# Altium schematic sheet FP_Connectors.SchDoc: =DocumentName
size A4; SPICEModelCache: <root> / <DocumentId>EZLIUZWI</DocumentId> / <CacheFrame Number="0"> / <Model Name="0603_155060gs75300" Kind="CKT"> / <Text>******** / .subckt 0603_155060GS75300 1 2 / D1 1 2 SMSW / .MODEL SMSW D / + IS=695.94E-6 / + N=5 / + RS=2.4677 / + IKF=16.109E-12 / + CJO=1.0000E-12 / + M=.3333 / + VJ=.75 / + BV=5 / + IBV=10.00E-6 / + TT=5.0000E-9 / .ends</Text> / </Model> / </CacheFrame> / </root>; Last modified by: Krzysztof Belewicz; DocumentNumber: 1; Revision: 0; SheetNumber: 1; SheetTotal: 1
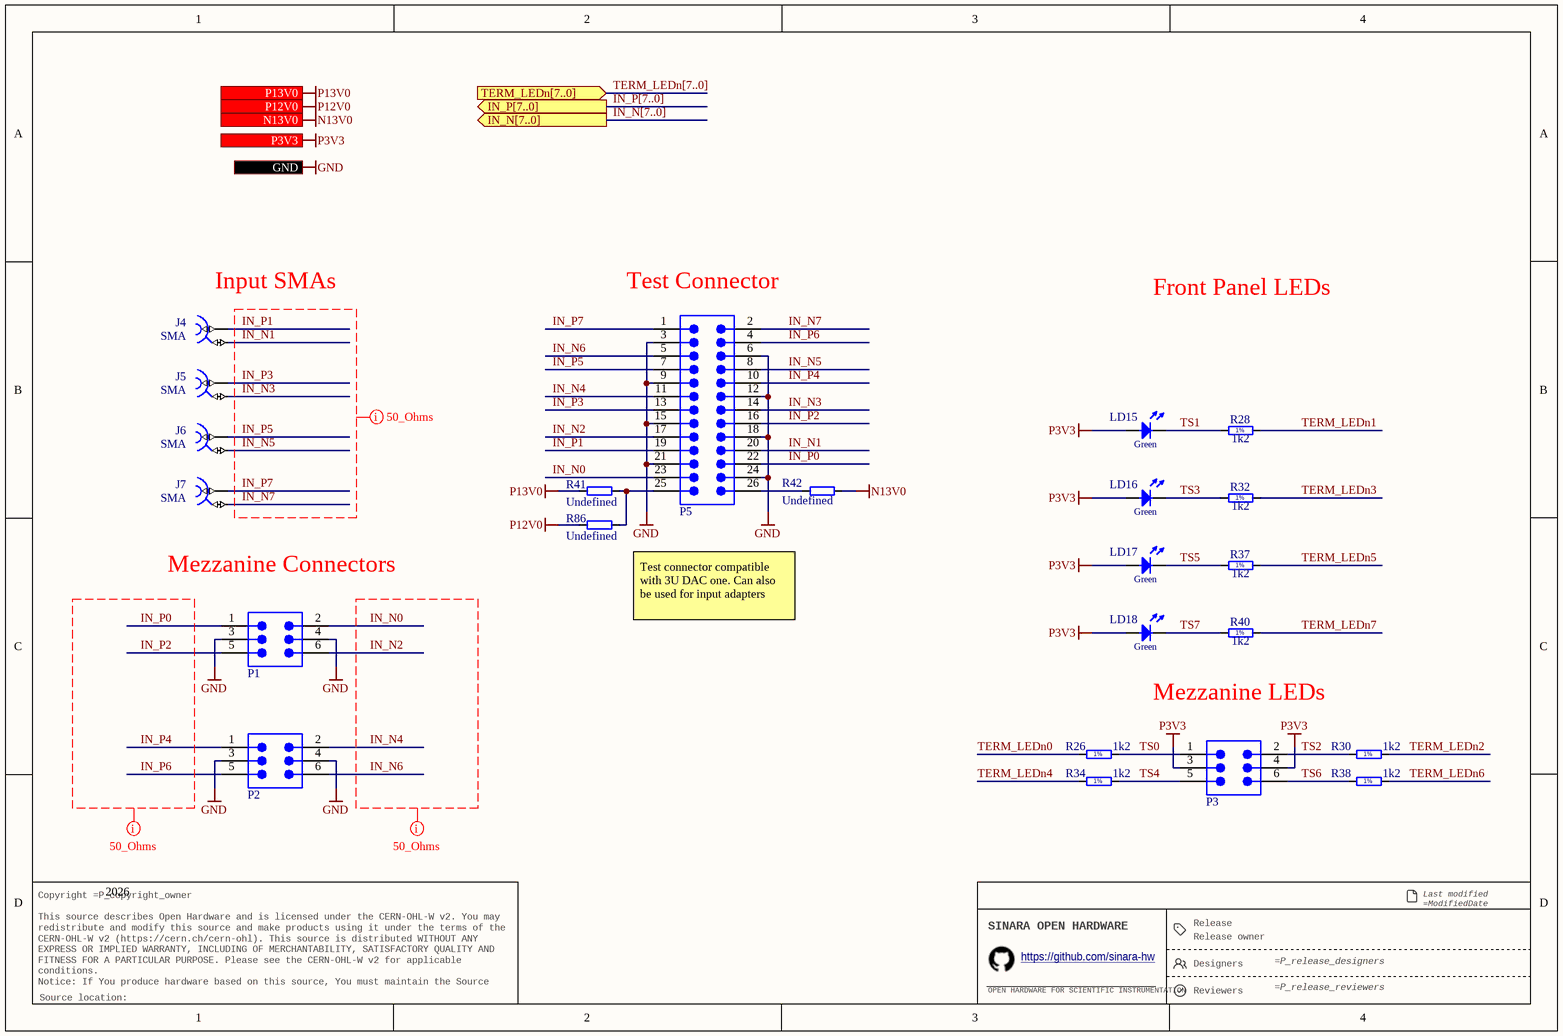
[diagram p0: FP_Connectors.SchDoc]

## Parts
J4  SMA  [DELOCK_65848]
J5  SMA  [DELOCK_65848]
J6  SMA  [DELOCK_65848]
J7  SMA  [DELOCK_65848]
LD15  Green  [LED_AVAGO_HSME-C120]
LD16  Green  [LED_AVAGO_HSME-C120]
LD17  Green  [LED_AVAGO_HSME-C120]
LD18  Green  [LED_AVAGO_HSME-C120]
P1  61300621121  [61300621121]  (value not drawn)
P2  61300621121  [61300621121]  (value not drawn)
P3  61300621121  [61300621121]  (value not drawn)
P5  61302621121  [61302621121]  (value not drawn)
R26  1k2  [RESC1608X55N]
R28  1k2  [RESC1608X55N]
R30  1k2  [RESC1608X55N]
R32  1k2  [RESC1608X55N]
R34  1k2  [RESC1608X55N]
R37  1k2  [RESC1608X55N]
R38  1k2  [RESC1608X55N]
R40  1k2  [RESC1608X55N]
R41  Undefined  [RESC1608X55N]
R42  Undefined  [RESC1608X55N]
R86  Undefined  [RESC1608X55N]

## Ports
GND, IN_N[7..0] (out), IN_P[7..0] (out), N13V0 (in), P3V3 (in), P12V0 (in), P13V0 (in), TERM_LEDn[7..0] (in)

## Nets
GND: P1.3 P1.4 P2.3 P2.4 P5.3 P5.6 P5.9 P5.12 P5.15 P5.18 P5.21 P5.24 ; port GND
N13V0: R42.2 ; port N13V0
P3V3: LD15.2(A) LD16.2(A) LD17.2(A) LD18.2(A) P3.3 P3.4 ; port P3V3
P12V0: R86.2 ; port P12V0
P13V0: R41.2 ; port P13V0
IN_N0: P1.2 P5.23
IN_N1: J4.2 P5.20
IN_N2: P1.6 P5.17
IN_N3: J5.2 P5.14
IN_N4: P2.2 P5.11
IN_N5: J6.2 P5.8
IN_N6: P2.6 P5.5
IN_N7: J7.2 P5.2
IN_P0: P1.1 P5.22
IN_P1: J4.1 P5.19
IN_P2: P1.5 P5.16
IN_P3: J5.1 P5.13
IN_P4: P2.1 P5.10
IN_P5: J6.1 P5.7
IN_P6: P2.5 P5.4
IN_P7: J7.1 P5.1
TERM_LEDn0: R26.2
TERM_LEDn1: R28.2
TERM_LEDn2: R30.2
TERM_LEDn3: R32.2
TERM_LEDn4: R34.2
TERM_LEDn5: R37.2
TERM_LEDn6: R38.2
TERM_LEDn7: R40.2
TS0: P3.1 R26.1
TS1: LD15.1(C) R28.1
TS2: P3.2 R30.1
TS3: LD16.1(C) R32.1
TS4: P3.5 R34.1
TS5: LD17.1(C) R37.1
TS6: P3.6 R38.1
TS7: LD18.1(C) R40.1
NetP5_25: P5.25 R41.1 R86.1
NetP5_26: P5.26 R42.1

## Buses and harness runs
bus IN_N[7..0] = port IN_N[7..0]
bus IN_P[7..0] = port IN_P[7..0]
bus TERM_LEDn[7..0] = port TERM_LEDn[7..0]

## Layout directives
net class 50_Ohms: IN_N0, IN_N1, IN_N2, IN_N3, IN_N4, IN_N5, IN_N6, IN_N7, IN_P0, IN_P1, IN_P2, IN_P3, IN_P4, IN_P5, IN_P6, IN_P7

## Notes on the sheet
- (near J4) Input SMAs
- (near P5) Test Connector
- Front Panel LEDs
- Mezzanine Connectors
- (near R86) Test connector compatible with 3U DAC one. Can also be used for input adapters
- Mezzanine LEDs
- 2026
- Release
- Last modified =ModifiedDate
  Sheet =sheetnumber of =sheettotal · Size A4
- Copyright =P_copyright_owner
  This source describes Open Hardware and is licensed under the CERN-OHL-W v2. You may redistribute and modify this source and make products using it under the terms of the CERN-OHL-W v2 (https://cern.ch/cern-ohl). This source is distributed WITHOUT ANY EXPRESS OR IMPLIED WARRANTY, INCLUDING OF MERCHANTABILITY, SATISFACTORY QUALITY AND FITNESS FOR A PARTICULAR PURPOSE. Please see the CERN-OHL-W v2 for applicable conditions.
  Notice: If You produce hardware based on this source, You must maintain the Source Location visible on the product, its packaging or its documentation.
- SINARA OPEN HARDWARE
- OPEN HARDWARE FOR SCIENTIFIC INSTRUMENTATION
- https://github.com/sinara-hw
- Release owner
- Designers
- Reviewers
- Source location:
- (in symbol R0603_1K2_1%_0.1W_100PPM) 1%

## Library data of the parts
J4-J7 = DELOCK_65848: 50 Ohm Through Hole SMA Right Angle PCB Jack; Manufacturer: DELOCK; Manufacturer Part Number: 5848 (4043619658480); PressFit: No; Part Number: DELOCK_65848; Component Kind: Standard; Component Type: Standard; Pin Count: 5; Family: SMA; Mounted: Yes; Socket: No; SMD: No; Sense: No; Status: None; Part Description: 50 Ohm Through Hole SMA Right Angle PCB Jack; ComponentHeight: 12.5; HelpURL: \\cern.ch\dfs\Applications\Altium\Datasheets\AMPHENOL_132203-16.pdf; Author: GK; CreateDate: 13.05.2019; LatestRevisionDate: 13.05.2019
LD15-LD18 = LED_AVAGO_HSME-C120: LED Green 1C 2A; Part Description: High Performance Right Angle Chip Green LED; Manufacturer: AVAGO TECHNOLOGIES; PressFit: No; Bonding: No; Part Number: LED_AVAGO_HSME-C120; Component Kind: Standard; Component Type: Standard; Color: Green; PackageDescription: Green Chip LED, 2-Leads, Body 1.7x1.1mm, Side Emitting Package; Manufacturer Part Number: HSME-C120; Pin Count: 2; Mounted: Yes; Socket: No; SMD: Yes; Sense: No; ComponentHeight: 0.7mm; HelpURL: \\cern.ch\dfs\Applications\Altium\Datasheets\LED_AVAGO_HSME-C120.pdf; ComponentLink1URL: \\cern.ch\dfs\Applications\Altium\Datasheets\LED_AVAGO_HSME-C110_DESIGN-GUIDE.pdf; ComponentLink1Description: Design Guide; Author: CERN DEM JMW; CreateDate: 22/07/2009; LatestRevisionDate: 20/06/2012
P1-P3 = 61300621121: WR-PHD Pin Header, THT, Vertical, pitch 2.54mm, 2 Row, 6P; Manufacturer: Wurth Elektronik; Contact Resistance: 20mOhm; Rated Current: 3A; Working Voltage: 250V; Withstanding Voltage: 500V; Manufacturer Part Number: 61300621121; Category: Board-to-Board Connectors; Match Code: WR-PHD; ComponentLink1Description: Website Link; ComponentLink1URL: https://www.we-online.com/redexpert/article/61300621121?ad; ComponentLink2Description: Datasheet Link; ComponentLink2URL: https://www.we-online.com/redexpert/spec/61300621121?ad; Mount: Through Hole; Operating Temperature Max: 105°C; Operating Temperature Min: -40°C; Packaging: Bag; Gender: Pin Header; Number of Pins: 6; Number of Rows: 2; Orientation: Vertical; Pitch: 2.54mm
P5 = 61302621121: WR-PHD Pin Header, THT, Vertical, pitch 2.54mm, 2 Row, 26P; Manufacturer: Wurth Elektronik; Contact Resistance: 20mOhm; Rated Current: 3A; Working Voltage: 250V; Withstanding Voltage: 500V; Manufacturer Part Number: 61302621121; Category: Board-to-Board Connectors; Match Code: WR-PHD; ComponentLink1Description: Website Link; ComponentLink1URL: https://www.we-online.com/redexpert/article/61302621121?ad; ComponentLink2Description: Datasheet Link; ComponentLink2URL: https://www.we-online.com/redexpert/spec/61302621121?ad; Mount: Through Hole; Operating Temperature Max: 105°C; Operating Temperature Min: -40°C; Packaging: Bag; Gender: Pin Header; Number of Pins: 26; Number of Rows: 2; Orientation: Vertical; Pitch: 2.54mm
R26 R28 R30 R32 R34 R37 R38 R40 = R0603_1K2_1%_0.1W_100PPM: Resistor - 1%; Part Description: General Purpose Thick Film Chip Resistor; Manufacturer: GENERIC; Manufacturer1 Part Number: NRC06F1201TRF; Power: 0.1W; TC: ±100ppm/°C; Part Number: R0603_1K2_1%_0.1W_100PPM; Component Kind: Standard; Component Type: Standard; Pin Count: 2; Value: 1k2; Status: Preferred; Tolerance: ±1%; Manufacturer Part Number: R0603_1K2_1%_0.1W_100PPM; Case: 0603; Mounted: Yes; Sense: No; Socket: No; SMD: Yes; Manufacturer1 Example: NIC COMPONENT; Manufacturer1 ComponentHeight: 0.55mm; HelpURL: \\cern.ch\dfs\Applications\Altium\Datasheets\R0603_NIC_NRC.pdf; Author: CERN DEM JLC; CreateDate: 03.12.2007; LatestRevisionDate: 13.03.2008
R41 R42 R86 = R0603_NO-VALUE: Resistor; Part Description: Reserved Footprint For a 0603 (1608) Chip Resistor; Mounted: No; Part Number: R0603_NO-VALUE; Component Kind: Standard; Component Type: Standard; Pin Count: 2; Value: Undefined; Status: None; Manufacturer: Undefined; Manufacturer Part Number: R0603_NO-VALUE; Case: 0603; Sense: No; Socket: No; SMD: Yes; Manufacturer1 Example: Undefined; Manufacturer1 Part Number: Undefined; Manufacturer1 ComponentHeight: Undefined; HelpURL: Undefined; Author: CERN DEM JLC; CreateDate: 03.12.2007; LatestRevisionDate: 13.03.2008